# Altium schematic sheet DXES101B-659637-ANALOG-INPUTS.SchDoc
size A3; Organization: Altium Limited; Address1: 3 Minna Close; Address2: Belrose; Address3: NSW 2085; Address4: Australia; SheetNumber: 6; SheetTotal: 10
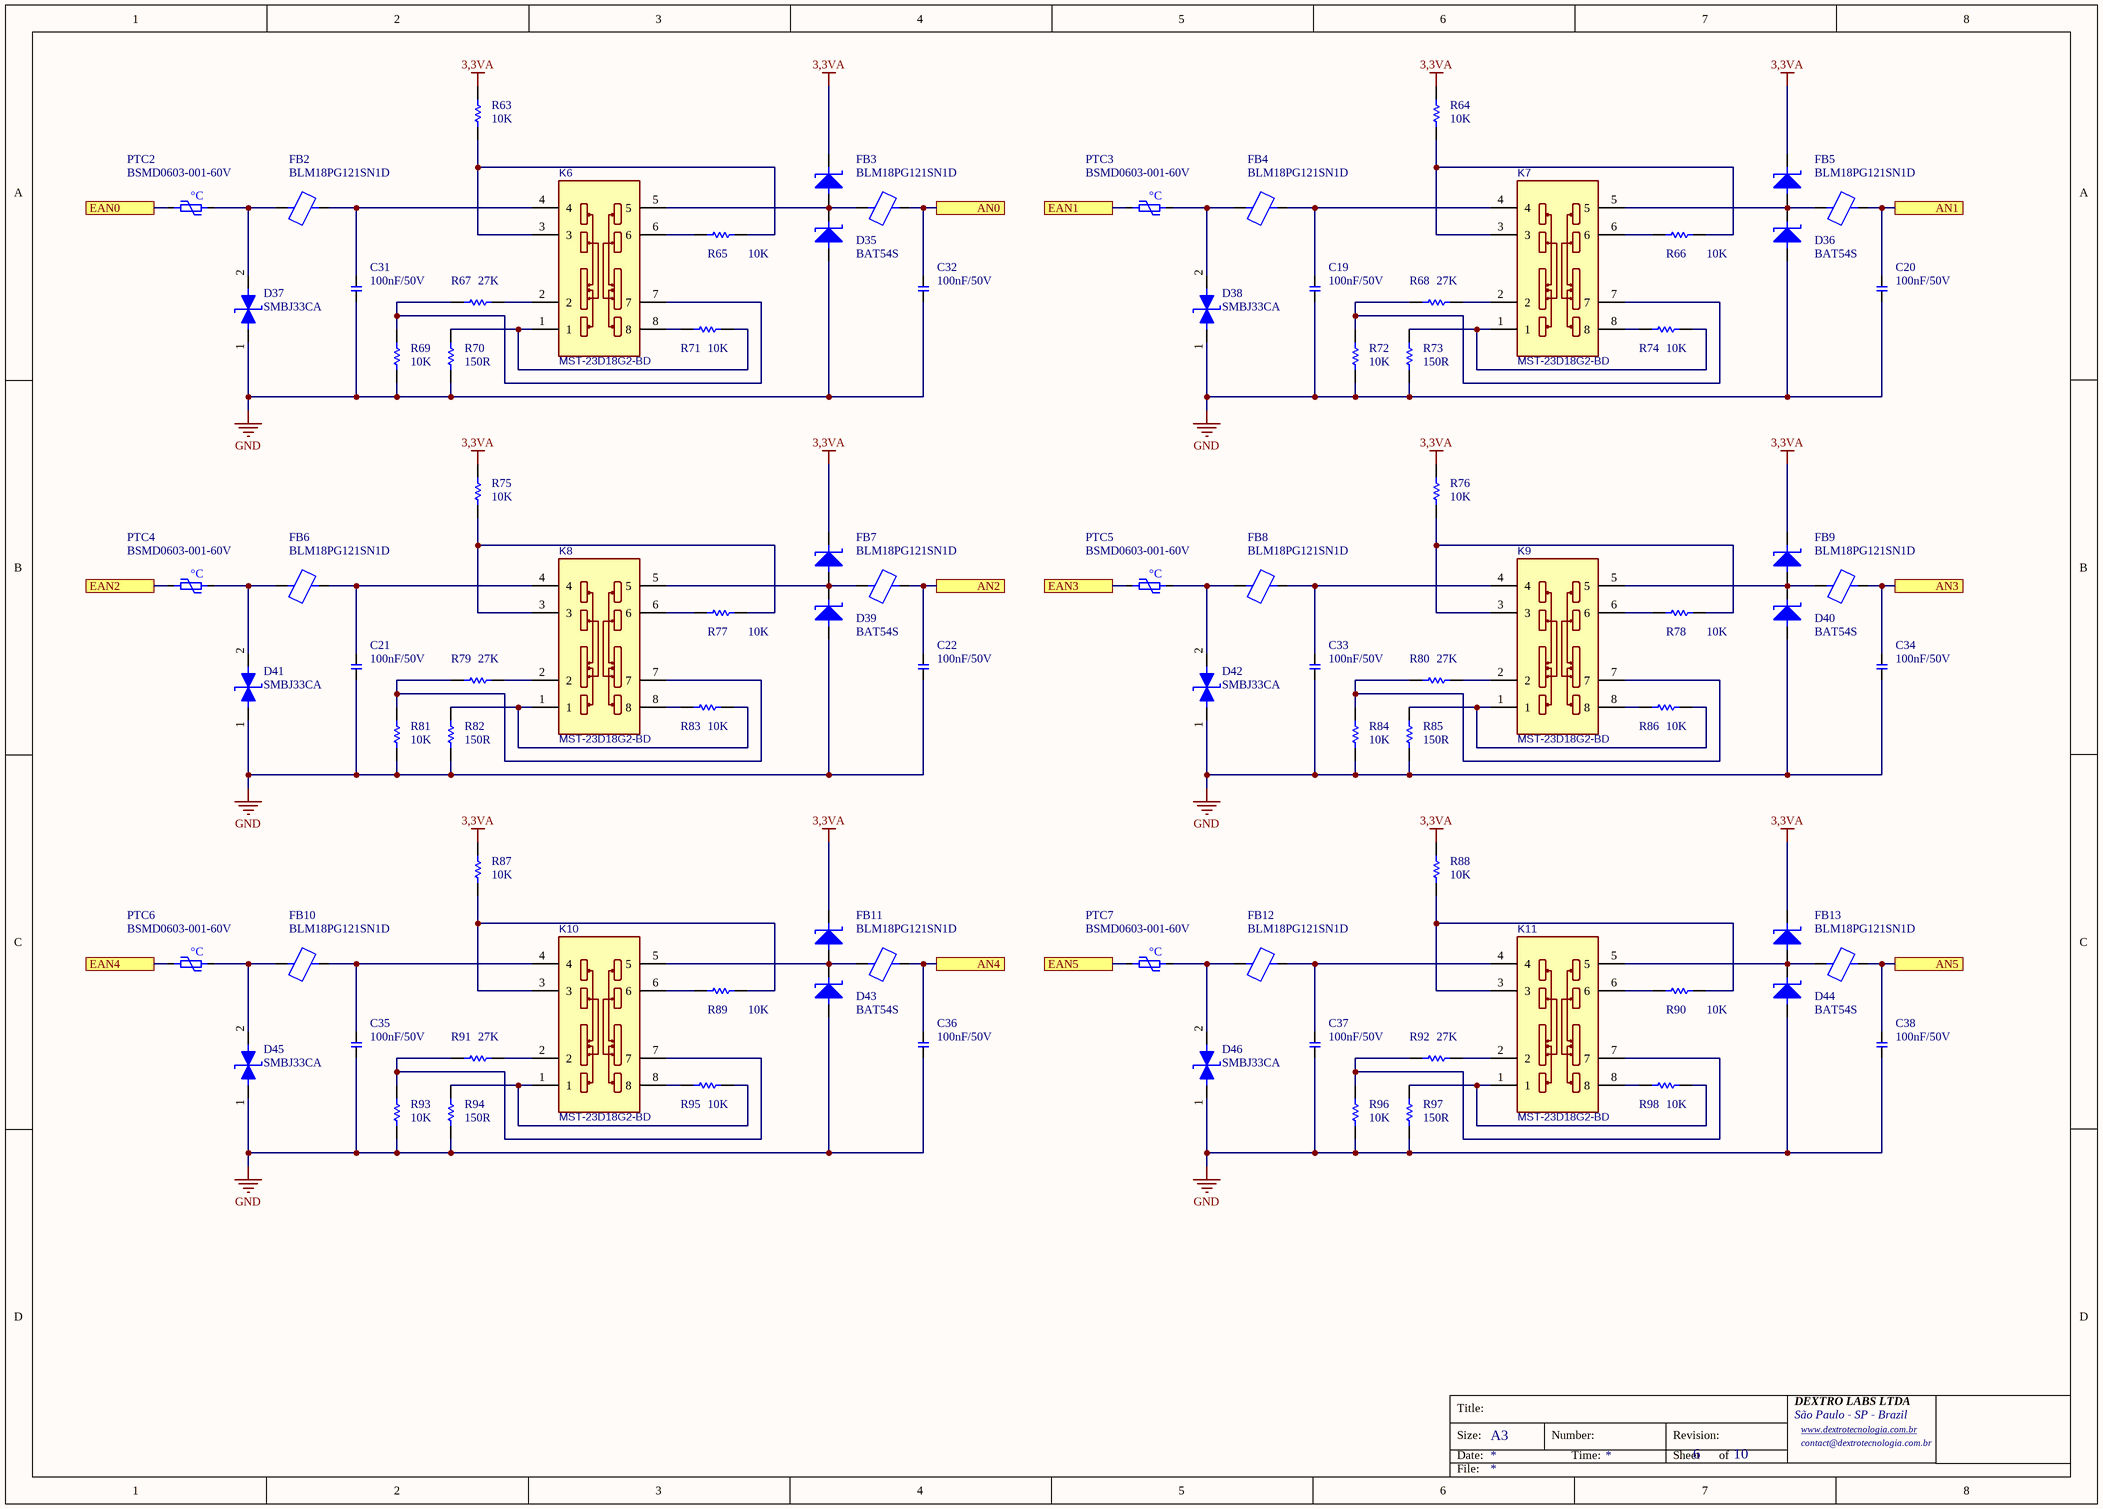
[diagram p0: DXES101B-659637-ANALOG-INPUTS.SchDoc]

## Parts
C19  100nF/50V  [CAP-0603]
C20  100nF/50V  [CAP-0603]
C21  100nF/50V  [CAP-0603]
C22  100nF/50V  [CAP-0603]
C31  100nF/50V  [CAP-0603]
C32  100nF/50V  [CAP-0603]
C33  100nF/50V  [CAP-0603]
C34  100nF/50V  [CAP-0603]
C35  100nF/50V  [CAP-0603]
C36  100nF/50V  [CAP-0603]
C37  100nF/50V  [CAP-0603]
C38  100nF/50V  [CAP-0603]
D35  BAT54S  [SOT23-3]
D36  BAT54S  [SOT23-3]
D37  SMBJ33CA  [DO214-AA]
D38  SMBJ33CA  [DO214-AA]
D39  BAT54S  [SOT23-3]
D40  BAT54S  [SOT23-3]
D41  SMBJ33CA  [DO214-AA]
D42  SMBJ33CA  [DO214-AA]
D43  BAT54S  [SOT23-3]
D44  BAT54S  [SOT23-3]
D45  SMBJ33CA  [DO214-AA]
D46  SMBJ33CA  [DO214-AA]
FB2  BLM18PG121SN1D  [RES-0603]
FB3  BLM18PG121SN1D  [RES-0603]
FB4  BLM18PG121SN1D  [RES-0603]
FB5  BLM18PG121SN1D  [RES-0603]
FB6  BLM18PG121SN1D  [RES-0603]
FB7  BLM18PG121SN1D  [RES-0603]
FB8  BLM18PG121SN1D  [RES-0603]
FB9  BLM18PG121SN1D  [RES-0603]
FB10  BLM18PG121SN1D  [RES-0603]
FB11  BLM18PG121SN1D  [RES-0603]
FB12  BLM18PG121SN1D  [RES-0603]
FB13  BLM18PG121SN1D  [RES-0603]
K6  MST-23D18G2-BD  [SW-SMD_SHOU_MST23D18G2]
K7  MST-23D18G2-BD  [SW-SMD_SHOU_MST23D18G2]
K8  MST-23D18G2-BD  [SW-SMD_SHOU_MST23D18G2]
K9  MST-23D18G2-BD  [SW-SMD_SHOU_MST23D18G2]
K10  MST-23D18G2-BD  [SW-SMD_SHOU_MST23D18G2]
K11  MST-23D18G2-BD  [SW-SMD_SHOU_MST23D18G2]
PTC2  BSMD0603-001-60V  [PTC-0603]
PTC3  BSMD0603-001-60V  [PTC-0603]
PTC4  BSMD0603-001-60V  [PTC-0603]
PTC5  BSMD0603-001-60V  [PTC-0603]
PTC6  BSMD0603-001-60V  [PTC-0603]
PTC7  BSMD0603-001-60V  [PTC-0603]
R63  10K  [RES-0603]
R64  10K  [RES-0603]
R65  10K  [RES-0603]
R66  10K  [RES-0603]
R67  27K  [RES-0603]
R68  27K  [RES-0603]
R69  10K  [RES-0603]
R70  150R  [RES-1210]
R71  10K  [RES-0603]
R72  10K  [RES-0603]
R73  150R  [RES-1210]
R74  10K  [RES-0603]
R75  10K  [RES-0603]
R76  10K  [RES-0603]
R77  10K  [RES-0603]
R78  10K  [RES-0603]
R79  27K  [RES-0603]
R80  27K  [RES-0603]
R81  10K  [RES-0603]
R82  150R  [RES-1210]
R83  10K  [RES-0603]
R84  10K  [RES-0603]
R85  150R  [RES-1210]
R86  10K  [RES-0603]
R87  10K  [RES-0603]
R88  10K  [RES-0603]
R89  10K  [RES-0603]
R90  10K  [RES-0603]
R91  27K  [RES-0603]
R92  27K  [RES-0603]
R93  10K  [RES-0603]
R94  150R  [RES-1210]
R95  10K  [RES-0603]
R96  10K  [RES-0603]
R97  150R  [RES-1210]
R98  10K  [RES-0603]

## Ports
AN0 (see DXES101B-659637-GENERAL[3B], DXES101B-659637-POWER-AND-SIGNALS[4B]), AN1 (see DXES101B-659637-GENERAL[3B], DXES101B-659637-POWER-AND-SIGNALS[5B]), AN2 (see DXES101B-659637-GENERAL[3B], DXES101B-659637-POWER-AND-SIGNALS[4B]), AN3 (see DXES101B-659637-GENERAL[3B], DXES101B-659637-POWER-AND-SIGNALS[5B]), AN4 (see DXES101B-659637-GENERAL[3B], DXES101B-659637-POWER-AND-SIGNALS[4B]), AN5 (see DXES101B-659637-GENERAL[3B], DXES101B-659637-POWER-AND-SIGNALS[5B]), EAN0 (see DXES101B-659637-GENERAL[4B]), EAN1 (see DXES101B-659637-GENERAL[4B]), EAN2 (see DXES101B-659637-GENERAL[4B]), EAN3 (see DXES101B-659637-GENERAL[4B]), EAN4 (see DXES101B-659637-GENERAL[4B]), EAN5 (see DXES101B-659637-GENERAL[4B])

## Nets
3,3VA: D35.2 D36.2 D39.2 D40.2 D43.2 D44.2 R63.2 R64.2 R75.2 R76.2 R87.2 R88.2
GND: C19.1 C20.1 C21.1 C22.1 C31.1 C32.1 C33.1 C34.1 C35.1 C36.1 C37.1 C38.1 D35.1 D36.1 D37.1(A2) D38.1(A2) D39.1 D40.1 D41.1(A2) D42.1(A2) D43.1 D44.1 D45.1(A2) D46.1(A2) R69.2 R70.1 R72.2 R73.1 R81.2 R82.1 R84.2 R85.1 R93.2 R94.1 R96.2 R97.1
AN0: C32.2 FB3.2 ; port AN0
AN1: C20.2 FB5.2 ; port AN1
AN2: C22.2 FB7.2 ; port AN2
AN3: C34.2 FB9.2 ; port AN3
AN4: C36.2 FB11.2 ; port AN4
AN5: C38.2 FB13.2 ; port AN5
EAN0: PTC2.1 ; port EAN0
EAN1: PTC3.1 ; port EAN1
EAN2: PTC4.1 ; port EAN2
EAN3: PTC5.1 ; port EAN3
EAN4: PTC6.1 ; port EAN4
EAN5: PTC7.1 ; port EAN5
NetC19_2: C19.2 FB4.2 K7.4
NetC21_2: C21.2 FB6.2 K8.4
NetC31_2: C31.2 FB2.2 K6.4
NetC33_2: C33.2 FB8.2 K9.4
NetC35_2: C35.2 FB10.2 K10.4
NetC37_2: C37.2 FB12.2 K11.4
NetD35_3: D35.3 FB3.1 K6.5
NetD36_3: D36.3 FB5.1 K7.5
NetD37_2: D37.2(A1) FB2.1 PTC2.2
NetD38_2: D38.2(A1) FB4.1 PTC3.2
NetD39_3: D39.3 FB7.1 K8.5
NetD40_3: D40.3 FB9.1 K9.5
NetD41_2: D41.2(A1) FB6.1 PTC4.2
NetD42_2: D42.2(A1) FB8.1 PTC5.2
NetD43_3: D43.3 FB11.1 K10.5
NetD44_3: D44.3 FB13.1 K11.5
NetD45_2: D45.2(A1) FB10.1 PTC6.2
NetD46_2: D46.2(A1) FB12.1 PTC7.2
NetK6_1: K6.1 R70.2 R71.1
NetK6_2: K6.2 R67.2
NetK6_3: K6.3 R63.1 R65.1
NetK6_6: K6.6 R65.2
NetK6_7: K6.7 R67.1 R69.1
NetK6_8: K6.8 R71.2
NetK7_1: K7.1 R73.2 R74.1
NetK7_2: K7.2 R68.2
NetK7_3: K7.3 R64.1 R66.1
NetK7_6: K7.6 R66.2
NetK7_7: K7.7 R68.1 R72.1
NetK7_8: K7.8 R74.2
NetK8_1: K8.1 R82.2 R83.1
NetK8_2: K8.2 R79.2
NetK8_3: K8.3 R75.1 R77.1
NetK8_6: K8.6 R77.2
NetK8_7: K8.7 R79.1 R81.1
NetK8_8: K8.8 R83.2
NetK9_1: K9.1 R85.2 R86.1
NetK9_2: K9.2 R80.2
NetK9_3: K9.3 R76.1 R78.1
NetK9_6: K9.6 R78.2
NetK9_7: K9.7 R80.1 R84.1
NetK9_8: K9.8 R86.2
NetK10_1: K10.1 R94.2 R95.1
NetK10_2: K10.2 R91.2
NetK10_3: K10.3 R87.1 R89.1
NetK10_6: K10.6 R89.2
NetK10_7: K10.7 R91.1 R93.1
NetK10_8: K10.8 R95.2
NetK11_1: K11.1 R97.2 R98.1
NetK11_2: K11.2 R92.2
NetK11_3: K11.3 R88.1 R90.1
NetK11_6: K11.6 R90.2
NetK11_7: K11.7 R92.1 R96.1
NetK11_8: K11.8 R98.2

## Notes on the sheet
- Title:
- Size:
- Date:
- A3
- Number:
- Time:
- Revision:
- Sheet
- of
- DEXTRO LABS LTDA
- São Paulo - SP - Brazil
- www.dextrotecnologia.com.br <http://www.dextrotecnologia.com.br>
- contact@dextrotecnologia.com.br
- File:
- (in symbol PTC-FUSE-60V-10mA-0603) °C

## Library data of the parts
C19-C22 C31-C38 = CAP-100nF/50V-0603-X7R-MLCC: 50V 100nF X7R ±10% 0603 Multilayer Ceramic Capacitors MLCC - SMD/SMT ROHS; LCSC: C14663
D35 D36 D39 D40 D43 D44 = BAT54S: 30V Dual 200mA 800mV@100mA SOT-23 Schottky Barrier Diodes (SBD) ROHS; LCSC: C916425
D37 D38 D41 D42 D45 D46 = SMBJ33CA: A 600W@8/20us 24.4V 33V Bidirectional 15V SMB(DO-214AA) ESD and Surge Protection (TVS/ESD) ROHS; LCSC: C3001986
FB2-FB13 = BLM18PG121SN1D: FERRITE BEAD 120Ω 0603 1LN; LCSC: C14709
K6-K11 = MST-23D18G2-BD: SLIDE-SWITCH-SP3T; Manufacturer: SHOU HAN(首韩); Contributor: lcsc; Supplier: LCSC; Supplier Part: C7507443; Manufacturer Part: MST-23D18G2-BD; JLCPCB Part Class: Extended Part; spicePre: U; spiceSymbolName: MST-23D18G2-BD; LCSC: C7507443
PTC2-PTC7 = PTC-FUSE-60V-10mA-0603: 60V 10mA 20A 50mA 15Ω 0603 PTC Resettable Fuses ROHS; LCSC: C914088
R63-R66 R69 R71 R72 R74-R78 R81 R83 R84 R86-R90 R93 R95 R96 R98 = RES-10K-1%-100mW-0603: 100mW Thick Film Resistor 75V ±100ppm/℃ ±1% 10kΩ 0603 Chip Resistor - Surface Mount ROHS; LCSC: C98220
R67 R68 R79 R80 R91 R92 = RES-27K-1%-100mW-0603: 100mW Thick Film Resistor 75V ±100ppm/℃ ±1% 10kΩ 0603 Chip Resistor - Surface Mount ROHS; LCSC: C98220
R70 R73 R82 R85 R94 R97 = RES-150R-1%-125mW-1210: 500mW 150Ω 200V ±100ppm/℃ Thick Film Resistor ±5% 1210 Chip Resistor - Surface Mount ROHS; LCSC: C620692